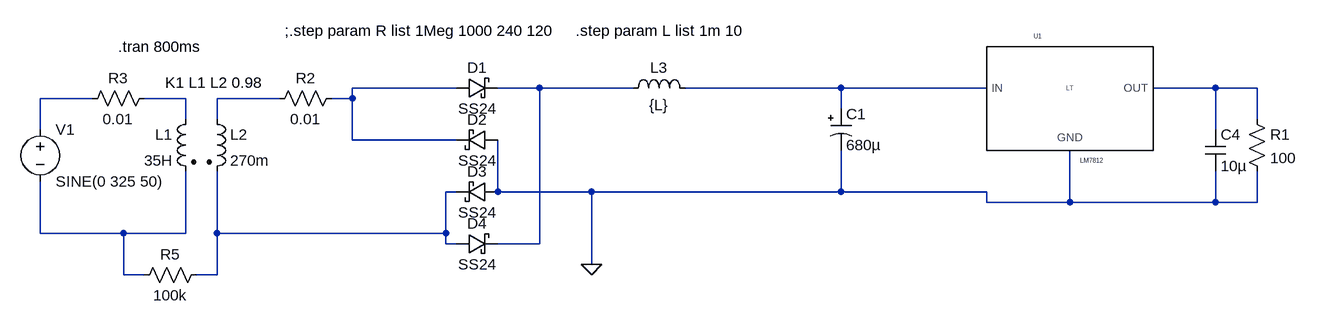
[diagram p0: schematic transformer_choke.asc]
transformer_choke.asc, the LTspice schematic file:
Version 4
SHEET 1 1916 680
WIRE 608 48 448 48
WIRE 736 48 672 48
WIRE 880 48 736 48
WIRE 1200 48 960 48
WIRE 1424 48 1200 48
WIRE 1776 48 1680 48
WIRE 1840 48 1776 48
WIRE 48 64 -32 64
WIRE 192 64 128 64
WIRE 336 64 240 64
WIRE 448 64 448 48
WIRE 448 64 416 64
WIRE 1200 80 1200 48
WIRE 192 96 192 64
WIRE 240 96 240 64
WIRE 1840 96 1840 48
WIRE -32 112 -32 64
WIRE 1776 112 1776 48
WIRE 448 128 448 64
WIRE 608 128 448 128
WIRE 608 208 592 208
WIRE 672 208 672 128
WIRE 816 208 672 208
WIRE 1200 208 1200 144
WIRE 1200 208 816 208
WIRE 1424 208 1200 208
WIRE 1424 224 1424 208
WIRE 1552 224 1552 144
WIRE 1552 224 1424 224
WIRE 1776 224 1776 176
WIRE 1776 224 1552 224
WIRE 1840 224 1840 176
WIRE 1840 224 1776 224
WIRE -32 272 -32 192
WIRE 96 272 -32 272
WIRE 192 272 192 176
WIRE 192 272 96 272
WIRE 240 272 240 176
WIRE 592 272 592 208
WIRE 592 272 240 272
WIRE 592 288 592 272
WIRE 608 288 592 288
WIRE 736 288 736 48
WIRE 736 288 672 288
WIRE 816 320 816 208
WIRE 96 336 96 272
WIRE 128 336 96 336
WIRE 240 336 240 272
WIRE 240 336 208 336
FLAG 816 320 0
SYMBOL ind2 224 80 R0
SYMATTR InstName L2
SYMATTR Value 270m
SYMATTR Type ind
SYMATTR SpiceLine Rser=22.7
SYMBOL ind2 208 80 M0
SYMATTR InstName L1
SYMATTR Value 35H
SYMATTR Type ind
SYMATTR SpiceLine Rser=3.5k
SYMBOL voltage -32 96 R0
WINDOW 123 0 0 Left 2
WINDOW 39 0 0 Left 2
SYMATTR InstName V1
SYMATTR Value SINE(0 325 50)
SYMBOL res 1824 80 R0
SYMATTR InstName R1
SYMATTR Value 100
SYMBOL schottky 608 64 R270
WINDOW 0 32 32 VTop 2
WINDOW 3 0 32 VBottom 2
SYMATTR InstName D1
SYMATTR Value SS24
SYMATTR Description Diode
SYMATTR Type diode
SYMBOL schottky 672 112 R90
WINDOW 0 0 32 VBottom 2
WINDOW 3 32 32 VTop 2
SYMATTR InstName D2
SYMATTR Value SS24
SYMATTR Description Diode
SYMATTR Type diode
SYMBOL schottky 672 192 R90
WINDOW 0 0 32 VBottom 2
WINDOW 3 32 32 VTop 2
SYMATTR InstName D3
SYMATTR Value SS24
SYMATTR Description Diode
SYMATTR Type diode
SYMBOL schottky 608 304 R270
WINDOW 0 32 32 VTop 2
WINDOW 3 0 32 VBottom 2
SYMATTR InstName D4
SYMATTR Value SS24
SYMATTR Description Diode
SYMATTR Type diode
SYMBOL polcap 1184 80 R0
WINDOW 3 24 56 Left 2
SYMATTR Value 680µ
SYMATTR InstName C1
SYMATTR Description Capacitor
SYMATTR Type cap
SYMATTR SpiceLine V=50 Irms=1.47 Rser=0.053 Lser=0 mfg="Panasonic" pn="ECA1HFQ681" type="Al electrolytic"
SYMBOL res 432 48 R90
WINDOW 0 0 56 VBottom 2
WINDOW 3 32 56 VTop 2
SYMATTR InstName R2
SYMATTR Value 0.01
SYMBOL res 144 48 R90
WINDOW 0 0 56 VBottom 2
WINDOW 3 32 56 VTop 2
SYMATTR InstName R3
SYMATTR Value 0.01
SYMBOL 7812 1552 48 R0
SYMATTR InstName U1
SYMBOL cap 1760 112 R0
SYMATTR InstName C4
SYMATTR Value 10µ
SYMBOL res 224 320 R90
WINDOW 0 0 56 VBottom 2
WINDOW 3 32 56 VTop 2
SYMATTR InstName R5
SYMATTR Value 100k
SYMBOL ind 864 64 R270
WINDOW 0 32 56 VTop 2
WINDOW 3 5 56 VBottom 2
SYMATTR InstName L3
SYMATTR Value {L}
TEXT 160 40 Left 2 !K1 L1 L2 0.98
TEXT 88 -16 Left 2 !.tran 800ms
TEXT 344 -40 Left 2 !;.step param R list 1Meg 1000 240 120
TEXT 792 -40 Left 2 !.step param L list 1m 10

The netlist it stands for:
* transformer_choke.asc
L2 N007 N008 270m Rser=22.7
L1 N006 N009 35H Rser=3.5k
V1 N005 N009 SINE(0 325 50)
R1 N004 0 100
D1 N001 N002 SS24
D2 0 N001 SS24
D3 0 N008 SS24
D4 N008 N002 SS24
C1 N003 0 680µ V=50 Irms=1.47 Rser=0.053 Lser=0 mfg="Panasonic" pn="ECA1HFQ681" type="Al electrolytic"
R2 N001 N007 0.01
R3 N006 N005 0.01
XU1 N003 0 N004 LM7812  ; pins IN GND OUT
C4 N004 0 10µ
R5 N008 N009 100k
L3 N002 N003 {L}
.model D D
.lib standard.dio
K1 L1 L2 0.98
.tran 800ms
;.step param R list 1Meg 1000 240 120
.step param L list 1m 10
.lib regulators.lib
.backanno
.end